# Altium schematic sheet l432.SchDoc
size A3; SheetNumber: 1; SheetTotal: 2
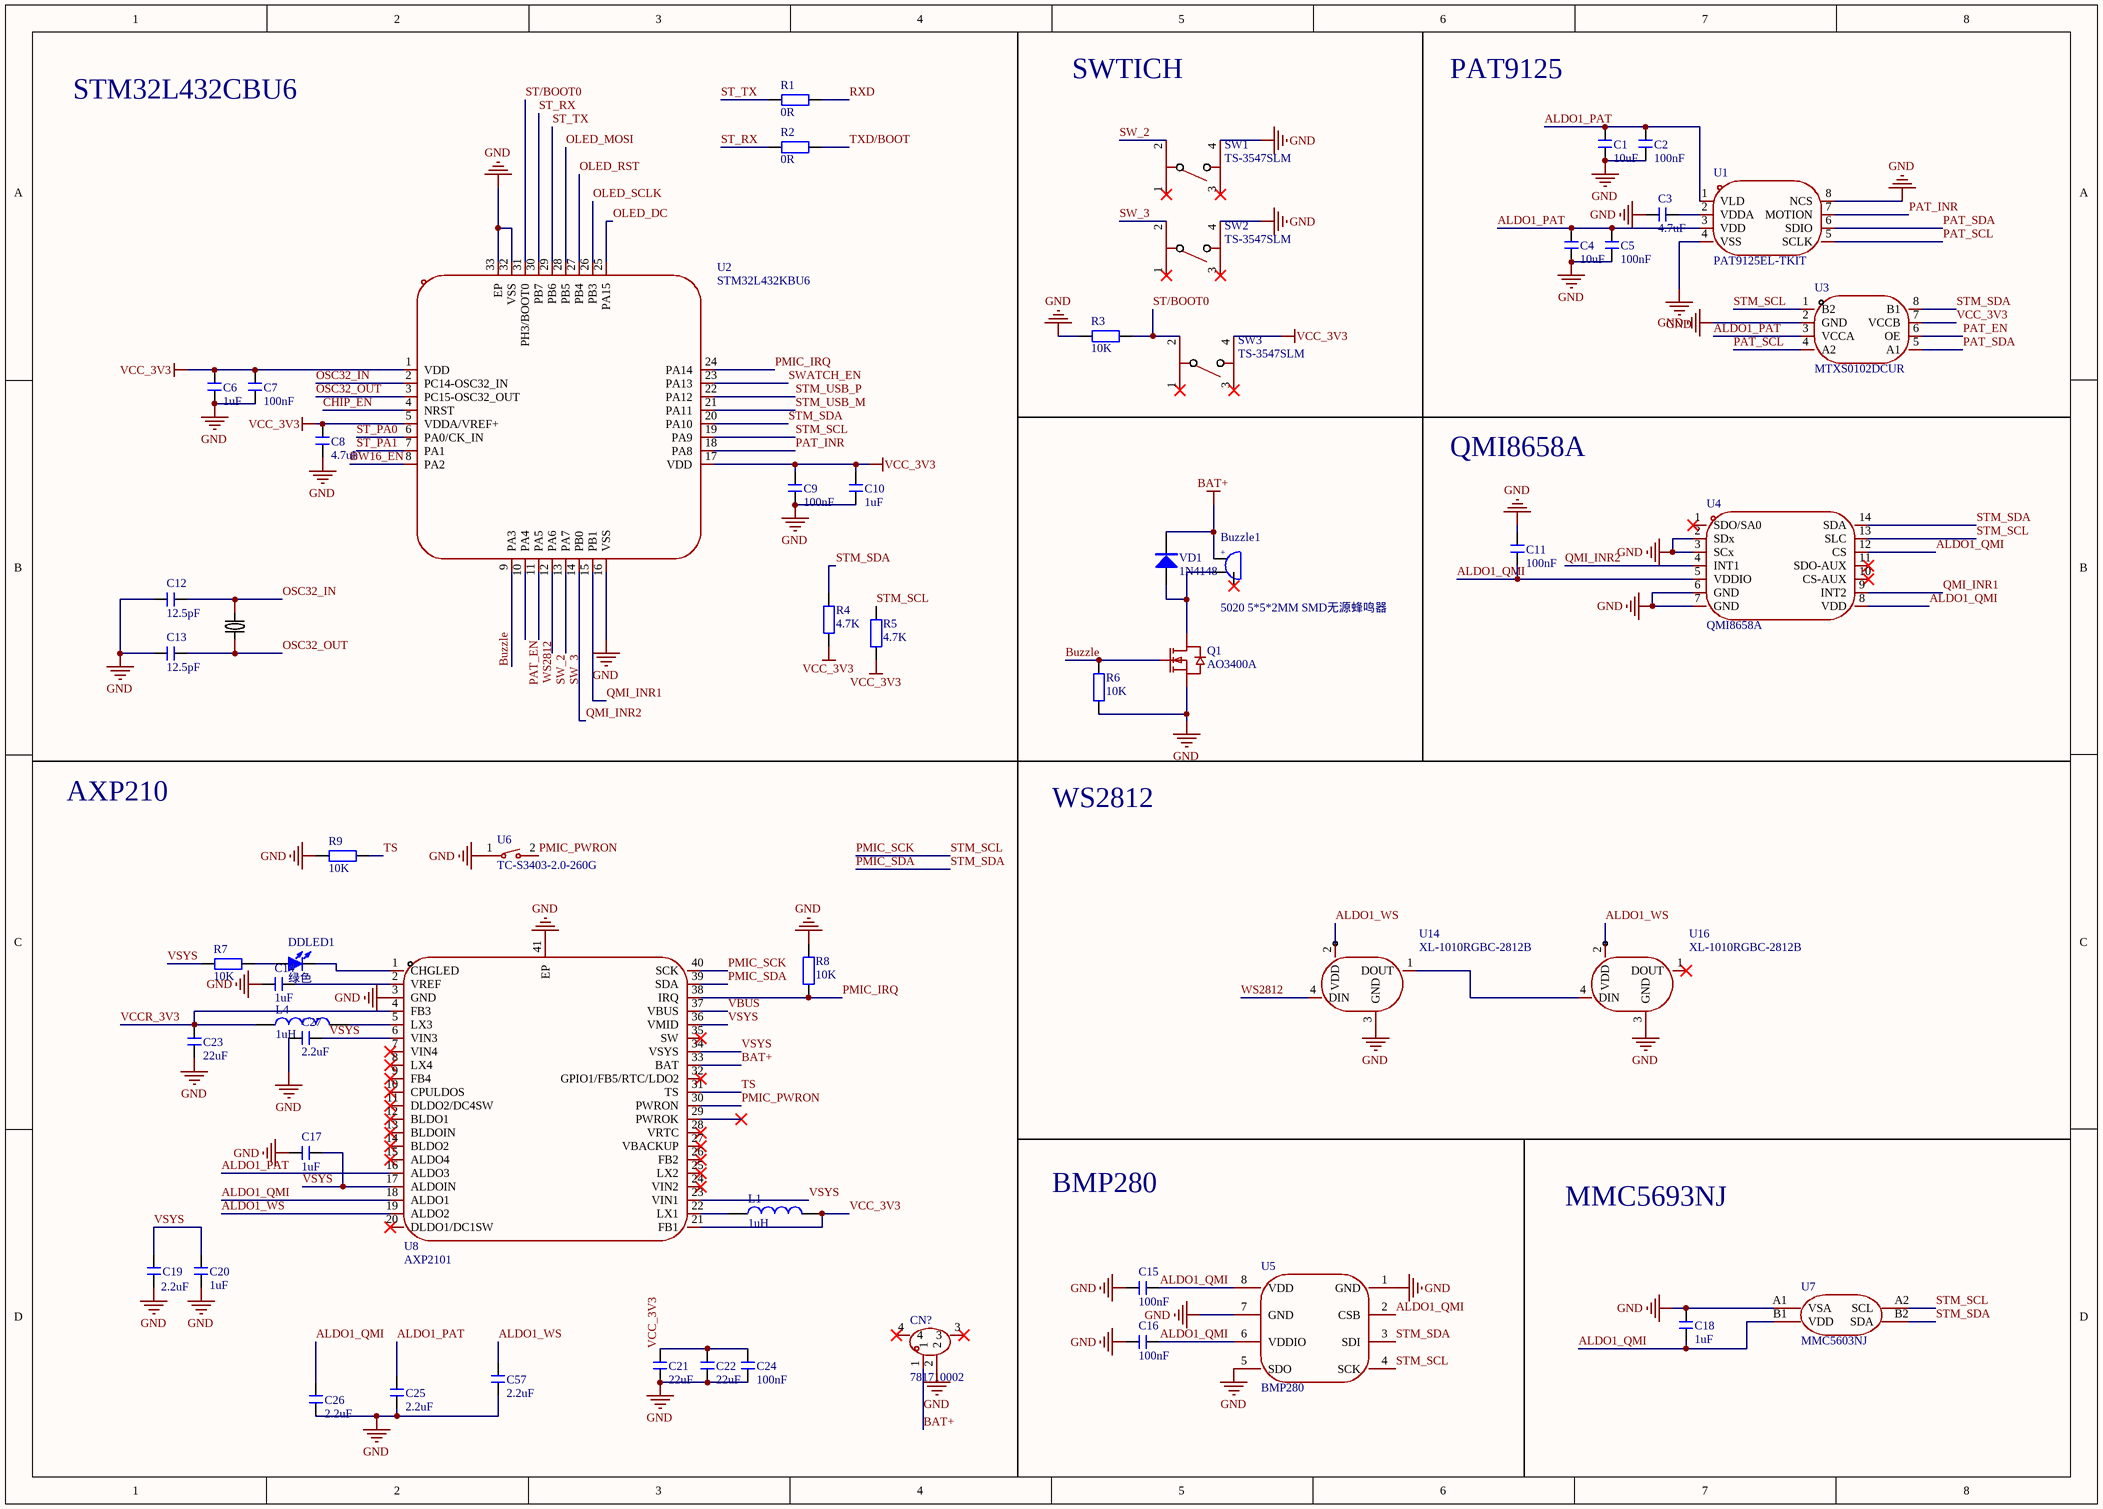
[diagram p0: l432.SchDoc]

## Parts
Buzzle1  5020 5*5*2MM SMD无源蜂鸣器  [5020 5*5*2MM SMD贴片超薄超小电磁式无源蜂鸣器]
C1  10uF  [C 0402_L]
C2  100nF  [C 0402_L]
C3  4.7uF  [C 0402_L]
C4  10uF  [C 0402_L]
C5  100nF  [C 0402_L]
C6  1uF  [C 0402_L]
C7  100nF  [C 0402_L]
C8  4.7uF  [C 0402_L]
C9  100nF  [C 0402_L]
C10  1uF  [C 0402_L]
C11  100nF  [C 0402_L]
C12  12.5pF  [C 0402_L]
C13  12.5pF  [C 0402_L]
C14  1uF  [C 0402_L]
C15  100nF  [C 0402_L]
C16  100nF  [C 0402_L]
C17  1uF  [C 0402_L]
C18  1uF  [C 0402_L]
C19  2.2uF  [C 0402_L]
C20  1uF  [C 0402_L]
C21  22uF  [C 0402_L]
C22  22uF  [C 0402_L]
C23  22uF  [C 0402_L]
C24  100nF  [C 0402_L]
C25  2.2uF  [C 0402_L]
C26  2.2uF  [C 0402_L]
C27  2.2uF  [C 0402_L]
C57  2.2uF  [C 0402_L]
CN?  781710002  [CONN-SMD_2P-P1.20_781710002]
DDLED1  绿色  [LED0402-RD]
L1  1uH  [L 0603]
L4  1uH  [L 0603]
Q1  AO3400A  [SOT-23-3_L2.9-W1.3-P1.90-LS2.4-BR]
R1  0R  [R 0402_L]
R2  0R  [R 0402_L]
R3  10K  [R 0402_L]
R4  4.7K  [R 0402_L]
R5  4.7K  [R 0402_L]
R6  10K  [R 0402_L]
R7  10K  [R 0402_L]
R8  10K  [R 0402_L]
R9  10K  [R 0402_L]
SW1  TS-3547SLM  [SW-SMD_TS-3547SLM]
SW2  TS-3547SLM  [SW-SMD_TS-3547SLM]
SW3  TS-3547SLM  [SW-SMD_TS-3547SLM]
U1  PAT9125EL-TKIT  [LGA-8_L3.5-W3.2-P0.80-BL]
U2  STM32L432KBU6  [UFQFPN-32_L5.0-W5.0-P0.50-TL-EP3.5]
U3  MTXS0102DCUR  [VSSOP-8_L2.1-W2.4-P0.50-LS3.2-BL]
U4  QMI8658A  [LGA-14L_L3.0-W2.5-P0.50-TL]
U5  BMP280  [LGA-8_L2.5-W2.0-P0.65_AMP6127]
U6  TC-S3403-2.0-260G  [SW-SMD_L3.0-W2.0-LS3.5]
U7  MMC5603NJ  [FLIPCHIP-4_L0.8-W0.8-R2-C2-P0.40-TL]
U8  AXP2101  [QFN-40_L5.0-W5.0-P0.40-TL-EP3.4]
U14  XL-1010RGBC-2812B  [LED-SMD_4P-L1.0-W1.0-TL_XL-1010RGBC-WS2812B]
U16  XL-1010RGBC-2812B  [LED-SMD_4P-L1.0-W1.0-TL_XL-1010RGBC-WS2812B]
VD1  1N4148  [SOD-323]
X1  32.768kHz  [FC-135R_L3.2-W1.5]  (value not drawn)

## Nets
BAT+: Buzzle1.1 CN?.1 U8.33(BAT) VD1.2(K)
GND: C1.1 C2.1 C3.1 C4.1 C5.1 C6.1 C7.1 C8.1 C9.1 C10.1 C11.1 C12.1 C13.1 C14.2 C15.1 C16.1 C17.1 C18.2 C19.2 C20.2 C21.2 C22.2 C23.1 C24.2 C25.2 C26.2 C27.2 C57.2 CN?.2 Q1.2(S) R3.2 R6.1 R8.1 R9.1 SW1.4 SW2.4 U1.4(VSS) U1.8(NCS) U2.16(VSS) U2.32(VSS) U2.33(EP) U3.2(GND) U4.2(SDx) U4.3(SCx) U4.6(GND) U4.7(GND) U5.1(GND) U5.5(SDO) U5.7(GND) U6.1 U7.A1(VSA) U8.3(GND) U8.41(EP) U14.3(GND) U16.3(GND)
VCC_3V3: C6.2 C7.2 C8.2 C9.2 C10.2 C21.1 C22.1 C24.1 L1.2 R4.1 R5.1 SW3.4 U2.1(VDD) U2.5(VDDA/VREF+) U2.17(VDD) U3.7(VCCB) U8.21(FB1)
ALDO1_PAT: C1.2 C2.2 C4.2 C5.2 C25.1 U1.1(VLD) U1.3(VDD) U3.3(VCCA) U8.16(ALDO3)
ALDO1_QMI: C11.2 C15.2 C16.2 C18.1 C26.1 U4.5(VDDIO) U4.8(VDD) U4.12(CS) U5.2(CSB) U5.6(VDDIO) U5.8(VDD) U7.B1(VDD) U8.18(ALDO1)
ALDO1_WS: C57.1 U8.19(ALDO2) U14.2(VDD) U16.2(VDD)
Buzzle: Q1.1(G) R6.2 U2.9(PA3)
BW16_EN: U2.8(PA2)
CHIP_EN: U2.4(NRST)
OLED_DC: U2.25(PA15)
OLED_MOSI: U2.28(PB5)
OLED_RST: U2.27(PB4)
OLED_SCLK: U2.26(PB3)
OSC32_IN: C12.2 U2.2(PC14-OSC32_IN) X1.2
OSC32_OUT: C13.2 U2.3(PC15-OSC32_OUT) X1.1
PAT_EN: U2.10(PA4) U3.6(OE)
PAT_INR: U1.7(MOTION) U2.18(PA8)
PAT_SCL: U1.5(SCLK) U3.4(A2)
PAT_SDA: U1.6(SDIO) U3.5(A1)
PMIC_IRQ: R8.2 U2.24(PA14) U8.38(IRQ)
PMIC_PWRON: U6.2 U8.30(PWRON)
PMIC_SCK: R5.2 U2.19(PA9) U3.1(B2) U4.13(SLC) U5.4(SCK) U7.A2(SCL) U8.40(SCK)  [also labelled STM_SCL]
PMIC_SDA: R4.2 U2.20(PA10) U3.8(B1) U4.14(SDA) U5.3(SDI) U7.B2(SDA) U8.39(SDA)  [also labelled STM_SDA]
QMI_INR1: U2.15(PB1) U4.9(INT2)
QMI_INR2: U2.14(PB0) U4.4(INT1)
RXD: R1.2
ST/BOOT0: R3.1 SW3.2 U2.31(PH3/BOOT0)
ST_PA0: U2.6(PA0/CK_IN)
ST_PA1: U2.7(PA1)
ST_RX: R2.1 U2.30(PB7)
ST_TX: R1.1 U2.29(PB6)
STM_USB_M: U2.21(PA11)
STM_USB_P: U2.22(PA12)
SW_2: SW1.2 U2.12(PA6)
SW_3: SW2.2 U2.13(PA7)
SWATCH_EN: U2.23(PA13)
TS: R9.2 U8.31(TS)
TXD/BOOT: R2.2
VBUS: U8.37(VBUS)
VCCR_3V3: C23.2 L4.1 U8.4(FB3)
VSYS: C17.2 C19.1 C20.1 C27.1 R7.1 U8.6(VIN3) U8.17(ALDOIN) U8.23(VIN1) U8.34(VSYS) U8.36(VMID)
WS2812: U2.11(PA5) U14.4(DIN)
NetBuzzle1_2: Buzzle1.2 Q1.3(D) VD1.1(A)
NetC3_2: C3.2 U1.2(VDDA)
NetC14_1: C14.1 U8.2(VREF)
NetDDLED1_1: DDLED1.1(A) R7.2
NetDDLED1_2: DDLED1.2(K) U8.1(CHGLED)
NetL1_1: L1.1 U8.22(LX1)
NetL4_2: L4.2 U8.5(LX3)
NetU14_1: U14.1(DOUT) U16.4(DIN)

Not connected (* = marked no-connect by the designer): Buzzle1 3; CN? 3* 4*; SW1 1* 3*; SW2 1* 3*; SW3 1* 3*; U4 1(SDO/SA0)* 10(CS-AUX)* 11(SDO-AUX)*; U8 7(VIN4)* 8(LX4)* 9(FB4)* 10(CPULDOS)* 11(DLDO2/DC4SW)* 12(BLDO1)* 13(BLDOIN)* 14(BLDO2)* 15(ALDO4)* 20(DLDO1/DC1SW)* 24(VIN2)* 25(LX2)* 26(FB2)* 27(VBACKUP)* 28(VRTC)* 29(PWROK)* 32(GPIO1/FB5/RTC/LDO2)* 35(SW)*; U16 1(DOUT)*

## Notes on the sheet
- STM32L432CBU6
- SWTICH
- PAT9125
- QMI8658A
- AXP210
- WS2812
- BMP280
- MMC5693NJ
- (in symbol 5020 SMD无源蜂鸣器) +

## Library data of the parts
Buzzle1 = 5020 SMD无源蜂鸣器: 5020 5*5*2MM SMD贴片超薄超小电磁式无源蜂鸣器
C1-C27 C57 = C: 贴片电容; BOM名称: 无极性贴片电容; 淘宝ID: 封装库来自淘宝 ID：黄晶宝石; 联系售后，技术支持: https://shop463601444.taobao.com; 唯一出售店铺网址: https://shop463601444.taobao.com
CN? = 781710002: Manufacturer: MOLEX; Add into BOM: yes; Pins Structure: 1x2P; Pitch: 1.2mm; Number of PINs Per Row: 2; Current Rating: 1.5A; Voltage Rating: 50V; Flame Retardant Rating: UL94V-0; Symbol: 781710002; Device: 781710002; LCSC Part Name: 1x2P 间距:1.2mm 卧贴; Supplier Part: C505023; Manufacturer Part: 781710002; Supplier Footprint: SMD,P=1.2mm,卧贴; JLCPCB Part Class: 扩展库; Datasheet: https://www.molex.com/content/dam/molex/molex-dot-com/products/automated/en-us/salesdrawingpdf/781/78171/781710002_sd.pdf?inline; Supplier: LCSC; Convert to PCB: yes; Mounting Type: 卧贴; Reference Series: -; Number of Pins: 2P; Number of Rows: 1; Row Spacing: -; Contact Material: 铜合金; Contact Plating: 金; Operating Temperature: -40℃~+105℃; Color: 黑色
DDLED1 = LED-SMD: 贴片LED; 版权归属: 封装库来自淘宝 ID：黄晶宝石; BOM名称: 贴片LED; 学习资源: https://shop463601444.taobao.com
L1 L4 = L: 小功率贴片电感; 淘宝ID: 封装库来自淘宝 ID：黄晶宝石; 封装库来自淘宝卖家 ID：黄晶宝石: 其他店铺购入均为盗版，不享受售后技术支持服务，请立即申请退款; BOM名称: 小功率贴片电感; 联系售后: https://shop463601444.taobao.com
Q1 = AO3400A: Manufacturer: HUASHUO(华朔); Symbol: AO3400A_C700953; Add into BOM: yes; Number: 1个N沟道; Drain to Source Voltage: 30V; Current - Continuous Drain(Id): 5.2A; RDS(on): 27mΩ@4.5V,5A; Pd - Power Dissipation: 1W; Gate Threshold Voltage (Vgs(th)): 850mV; Gate Charge(Qg): 11.7nC@4.5V; Input Capacitance(Ciss): 927pF@15V; Reverse Transfer Capacitance (Crss@Vds): 61pF@15V; Device: AO3400A; LCSC Part Name: N沟道,电流:5.2A,耐压:30V; Supplier Part: C700953; Manufacturer Part: AO3400A; Supplier Footprint: SOT-23; JLCPCB Part Class: 扩展库; Datasheet: https://item.szlcsc.com/datasheet/AO3400A/736021.html; Supplier: LCSC; Convert to PCB: yes; Operating Temperature: -55℃~+150℃
R1-R9 = R: 贴片电阻; 版权归属: 来自淘宝 ID：黄晶宝石; 封装库来自淘宝卖家 ID：黄晶宝石: 其他店铺购入均为盗版，不享受售后技术支持服务，请立即申请退款; BOM名称: 贴片电阻; 联系售后: https://shop463601444.taobao.com
SW1-SW3 = TS-3547SLM: Manufacturer: 康深; Add into BOM: yes; Circuit: 单刀单掷; Actuator Style: 矩形按钮; Operating Force: 2.5N; Switch Height: 1.6mm; with Bracket: 不带支架; Contact Current: 50mA; Voltage Rating: 12V; Actuator/Cap Color: 黑色; Symbol: TS-3547SLM; Device: TS-3547SLM; LCSC Part Name: 3.5*4.7mm 按键开关 贴膜中乌龟四脚 有定位  编带; Supplier Part: C47734524; Manufacturer Part: TS-3547SLM; Supplier Footprint: SMD; JLCPCB Part Class: 扩展库; Datasheet: https://item.szlcsc.com/datasheet/TS-3547SLM/49966945.html; Supplier: LCSC; Convert to PCB: yes; Mounting Type: 卧贴; Length: 6.2mm; Width: 4.4mm; With Lamp: -; Termination Style: SMD接片
U1 = PAT9125EL-TKIT: Add into BOM: yes; Symbol: PAT9125EL-TKIT; Device: PAT9125EL-TKIT; LCSC Part Name: PAT9125EL-TKIT; Supplier Part: C2832657; Manufacturer Part: PAT9125EL-TKIT; Supplier Footprint: LGA-8(3.2x3.5x0.8mm); JLCPCB Part Class: 扩展库; Supplier: LCSC; Convert to PCB: yes
U2 = STM32L432KBU6: Manufacturer: ST(意法半导体); Add into BOM: yes; CPU Core: ARM-M4; CPU Maximum Speed: 80MHz; Program Storage Size: 128KB; Program Memory Type: FLASH; Number of I/O: 26; ADC (Bit): 12bit; Voltage - Supply: 1.71V~3.6V; Symbol: STM32L432KBU6; Device: STM32L432KBU6; LCSC Part Name: 带FPU的超低功耗80 Mhz Arm Cortex-M4 MCU，具有128-KB Flash存储器和USB; Supplier Part: C94784; Manufacturer Part: STM32L432KBU6; Supplier Footprint: UFQFPN-32(5x5); JLCPCB Part Class: 扩展库; Datasheet: https://item.szlcsc.com/datasheet/STM32L432KBU6/95984.html; Supplier: LCSC; Convert to PCB: yes; DAC (Bit): 12bit; Applications: -
U3 = MTXS0102DCUR: Manufacturer: MSKSEMI(美森科); Add into BOM: yes; Symbol: MTXS0102DCUR; Device: MTXS0102DCUR; LCSC Part Name: MTXS0102DCUR; Supplier Part: C42403135; Manufacturer Part: MTXS0102DCUR; Supplier Footprint: VSSOP-8; JLCPCB Part Class: 扩展库; Datasheet: https://item.szlcsc.com/datasheet/MTXS0102DCUR/44365554.html; Supplier: LCSC; Convert to PCB: yes
U4 = QMI8658A: Add into BOM: yes; Symbol: QMI8658A; Device: QMI8658A; LCSC Part Name: QMI8658A; Supplier Part: C9900008605; Manufacturer Part: QMI8658A; Supplier Footprint: LGA-14; JLCPCB Part Class: 扩展库; Supplier: LCSC; Convert to PCB: yes
U5 = BMP280: Manufacturer: Bosch(博世); Add into BOM: yes; Pressure range: 30Kpa~1.1bar; Voltage - Supply: 1.71V~3.6V; Standby Current: 300nA; Interface: SPI；I2C; Absolute Accuracy: 1hpa; Relative Accuracy: 0.12hpa; Temperature Coefficient of Offset(TCO): 1.5pa/K; Symbol: BMP280; Device: BMP280; LCSC Part Name: BMP280 停产; Supplier Part: C83291; Manufacturer Part: BMP280; Supplier Footprint: LGA-8(2x2.5); JLCPCB Part Class: 扩展库; Datasheet: https://item.szlcsc.com/datasheet/BMP280/84455.html; Supplier: LCSC; Convert to PCB: yes; Module: -; Features: 待机模式；集成ADC与数字接口；片内温度输出；片内校准与非易失存储; Response time: -; Operating Temperature: -40℃~+85℃
U6 = TC-S3403-2.0-260G: 微动开关; Manufacturer: HCTL(华灿天禄); Add into BOM: yes; Circuit: 单刀单掷; Actuator Style: 圆形按钮; Operating Force: 2.6N; Switch Length: 3.95mm; Switch Width: 3mm; Switch Height: 2mm; Strike Gundam: 不带; Contact Current: 50mA; Voltage Rating (DC): 12V; Insulation Resistance: 100MΩ; Actuator/Cap Color: 黑色; With Lamp: 无; Mechanical Life: 5万次; Symbol: TC-S3403-2.0-260G; Device: TC-S3403-2.0-260G; LCSC Part Name: TC-S3403-2.0-260G; Supplier Part: C5372844; Manufacturer Part: TC-S3403-2.0-260G; Supplier Footprint: SMD; Datasheet: https://atta.szlcsc.com/upload/public/pdf/source/20230320/549E467C3F97F31F1E4EF0A0B79060CE.pdf; Supplier: LCSC; Convert to PCB: yes; Mounting Style: 立贴; Voltage Rating (AC): -; Operating Temperature: -25℃~+70℃
U7 = MMC5603NJ: Manufacturer: MEMSIC(美新); Add into BOM: yes; Magnetic Sensing Range(X,Y): ±3mT; Output bit: 20bit; Interface Type: I2C; Voltage - Supply: 1.62V~3.6V; Current - Supply: 3.4mA；1.3mA；2.4mA；750uA; Symbol: MMC5603NJ; Device: MMC5603NJ; LCSC Part Name: 三轴磁传感器; Supplier Part: C404328; Manufacturer Part: MMC5603NJ; Supplier Footprint: WLP-4(0.8x0.8); JLCPCB Part Class: 扩展库; Datasheet: https://item.szlcsc.com/datasheet/MMC5603NJ/391847.html; Supplier: LCSC; Convert to PCB: yes; Magnetic Sensing Range(Z): ±3mT; Operating Temperature: -40℃~+85℃
U8 = AXP2101: Manufacturer: x-powers; Add into BOM: yes; Symbol: AXP2101; Device: AXP2101; LCSC Part Name: MINI-FIT 系列 TPA 2.0 端子 / 连接器; Supplier Part: C3036461; Manufacturer Part: AXP2101; Supplier Footprint: QFN-40-EP(5x5); JLCPCB Part Class: 扩展库; Datasheet: https://item.szlcsc.com/datasheet/AXP2101/3587325.html; Supplier: LCSC; Convert to PCB: yes
U14 U16 = XL-1010RGBC-2812B: Manufacturer: XINGLIGHT(成兴光); Symbol: XL-1010RGBC-WS2812B; Add into BOM: yes; Wavelength: 620nm~625nm；465nm~475nm；520nm~530nm; Luminous Intensity: 300mcd；800mcd；200mcd; Fixed-Frequency Pwm Mode: 1kHz; Data Transmission Rate: 800Kbit/s; Voltage - Supply: 4.5V~5.5V; Quiescent Current: 0.35mA; Lens Color: 无色透明透镜; ESD Withstand Voltage: 2000V; Installation method: 正贴; Peak Wavelength: R:625nm；B:470nm；G:525nm; Viewing Angle: 120°; Device: XL-1010RGBC-2812B; LCSC Part Name: XL-1010RGBC-WS2812B; Supplier Part: C5349953; Manufacturer Part: XL-1010RGBC-2812B; Supplier Footprint: SMD,1x1mm; JLCPCB Part Class: 扩展库; Datasheet: https://item.szlcsc.com/datasheet/XL-1010RGBC-2812B/6136402.html; Supplier: LCSC; Convert to PCB: yes; Operating Temperature: -20℃~+85℃; Length: 1mm; Width: 0.8mm; Height: 1mm
VD1 = 1N4148: 高速开关二极管; 版权归属: 源创客; BOM名称: 高速开关二极管; 学习资源: www.ooocke.com
X1 = Q13FC13500004_C32346: 晶振 32.768k; Manufacturer: EPSON(爱普生); Symbol: Q13FC1350000400; Add into BOM: yes; Crystal Type: 贴片晶振; Normal temperature Frequency Tolerance: ±20ppm; External load capacitor: 12.5pF; Equivalent Series Resistance (ESR): 70kΩ; Name: 32.768kHz; Device: Q13FC13500004_C32346; LCSC Part Name: 32.768kHz ±20ppm 12.5pF; Supplier Part: C32346; Manufacturer Part: Q13FC13500004; Supplier Footprint: SMD3215-2P; JLCPCB Part Class: Basic Part; Datasheet: https://atta.szlcsc.com/upload/public/pdf/source/20240418/0E0FF5F0356BA3753F616001439D1416.pdf; Supplier: LCSC; Convert to PCB: yes; Value: 32.768kHz; Operating Temperature: -40℃~+85℃